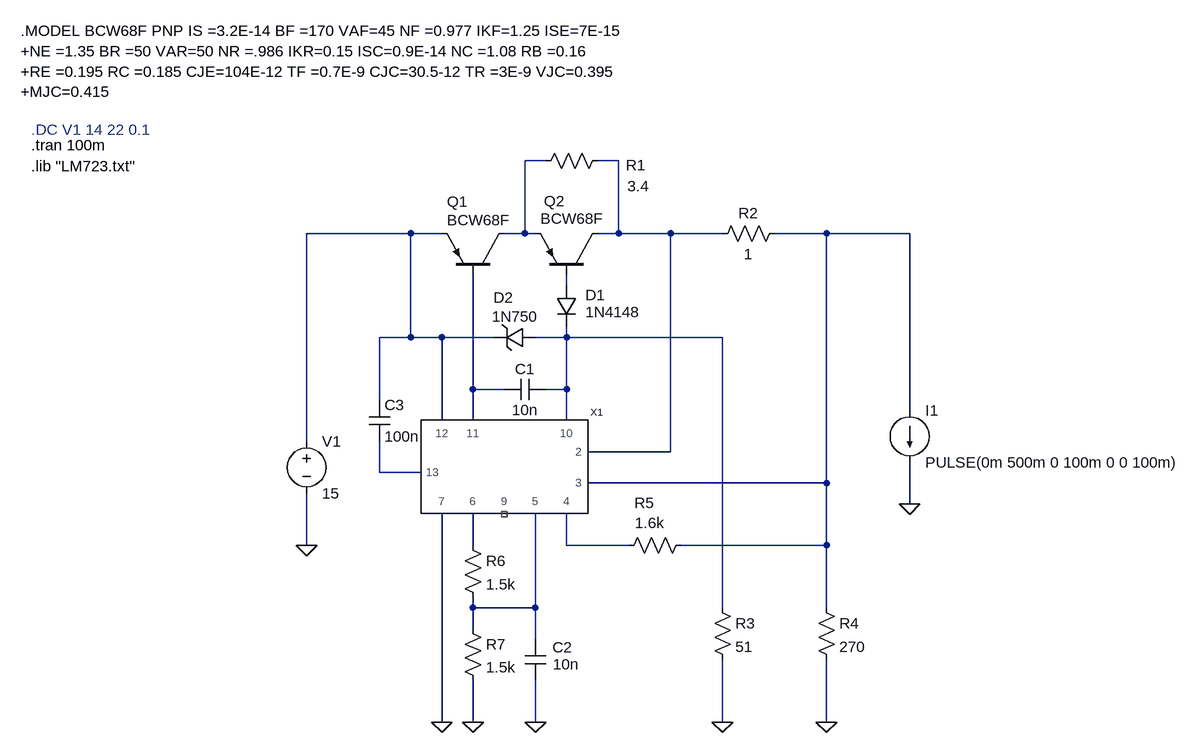
[diagram p0: schematic Lab8Lm723.asc]
Lab8Lm723.asc, the LTspice schematic file:
Version 4
SHEET 1 2652 1644
WIRE 560 -624 528 -624
WIRE 672 -624 640 -624
WIRE 352 -512 192 -512
WIRE 400 -512 352 -512
WIRE 528 -512 528 -624
WIRE 528 -512 496 -512
WIRE 544 -512 528 -512
WIRE 672 -512 672 -624
WIRE 672 -512 640 -512
WIRE 752 -512 672 -512
WIRE 832 -512 752 -512
WIRE 992 -512 912 -512
WIRE 1120 -512 992 -512
WIRE 592 -432 592 -448
WIRE 352 -352 352 -512
WIRE 352 -352 304 -352
WIRE 400 -352 352 -352
WIRE 480 -352 400 -352
WIRE 592 -352 592 -368
WIRE 592 -352 544 -352
WIRE 832 -352 592 -352
WIRE 448 -272 448 -448
WIRE 496 -272 448 -272
WIRE 592 -272 592 -352
WIRE 592 -272 560 -272
WIRE 304 -256 304 -352
WIRE 1120 -240 1120 -512
WIRE 400 -224 400 -352
WIRE 448 -224 448 -272
WIRE 592 -224 592 -272
WIRE 192 -192 192 -512
WIRE 752 -176 752 -512
WIRE 752 -176 624 -176
WIRE 304 -144 304 -192
WIRE 368 -144 304 -144
WIRE 992 -128 992 -512
WIRE 992 -128 624 -128
WIRE 1120 -96 1120 -160
WIRE 192 -32 192 -112
WIRE 448 -32 448 -80
WIRE 592 -32 592 -80
WIRE 688 -32 592 -32
WIRE 992 -32 992 -128
WIRE 992 -32 768 -32
WIRE 448 64 448 48
WIRE 544 64 544 -80
WIRE 544 64 448 64
WIRE 832 64 832 -352
WIRE 992 64 992 -32
WIRE 448 96 448 64
WIRE 544 112 544 64
WIRE 400 240 400 -80
WIRE 448 240 448 176
WIRE 544 240 544 176
WIRE 832 240 832 144
WIRE 992 240 992 144
FLAG 192 -32 0
FLAG 1120 -96 0
FLAG 832 240 0
FLAG 992 240 0
FLAG 400 240 0
FLAG 448 240 0
FLAG 544 240 0
SYMBOL LM723 496 -144 R0
SYMATTR InstName X1
SYMATTR Prefix X
SYMATTR SpiceModel LM723
SYMBOL voltage 192 -208 R0
WINDOW 123 0 0 Left 2
WINDOW 39 0 0 Left 2
SYMATTR InstName V1
SYMATTR Value 15
SYMBOL pnp 496 -448 M270
WINDOW 0 113 88 VLeft 2
WINDOW 3 85 88 VLeft 2
SYMATTR InstName Q1
SYMATTR Value BCW68F
SYMBOL pnp 640 -448 M270
WINDOW 0 114 83 VLeft 2
WINDOW 3 87 88 VLeft 2
SYMATTR InstName Q2
SYMATTR Value BCW68F
SYMBOL diode 576 -432 R0
WINDOW 0 45 15 Left 2
WINDOW 3 45 41 Left 2
SYMATTR InstName D1
SYMATTR Value 1N4148
SYMBOL res 656 -640 R90
WINDOW 0 38 -43 VBottom 2
WINDOW 3 39 -47 VTop 2
SYMATTR InstName R1
SYMATTR Value 3.4
SYMBOL cap 560 -288 R90
WINDOW 0 0 32 VBottom 2
WINDOW 3 32 32 VTop 2
SYMATTR InstName C1
SYMATTR Value 10n
SYMBOL res 928 -528 R90
WINDOW 0 0 56 VBottom 2
WINDOW 3 32 56 VTop 2
SYMATTR InstName R2
SYMATTR Value 1
SYMBOL zener 544 -368 R90
WINDOW 0 -30 49 VBottom 2
WINDOW 3 -32 31 VTop 2
SYMATTR InstName D2
SYMATTR Value 1N750
SYMATTR Description Diode
SYMATTR Type diode
SYMBOL res 816 48 R0
SYMATTR InstName R3
SYMATTR Value 51
SYMBOL res 976 48 R0
SYMATTR InstName R4
SYMATTR Value 270
SYMBOL res 784 -48 R90
WINDOW 0 -34 72 VBottom 2
WINDOW 3 -34 64 VTop 2
SYMATTR InstName R5
SYMATTR Value 1.6k
SYMBOL res 432 -48 R0
SYMATTR InstName R6
SYMATTR Value 1.5k
SYMBOL res 432 80 R0
SYMATTR InstName R7
SYMATTR Value 1.5k
SYMBOL cap 528 112 R0
WINDOW 0 42 13 Left 2
WINDOW 3 43 39 Left 2
SYMATTR InstName C2
SYMATTR Value 10n
SYMBOL cap 288 -256 R0
SYMATTR InstName C3
SYMATTR Value 100n
SYMBOL current 1120 -240 R0
WINDOW 123 0 0 Left 0
WINDOW 39 0 0 Left 0
SYMATTR InstName I1
SYMATTR Value PULSE(0m 500m 0 100m 0 0 100m)
TEXT -232 -648 Left 2 !.tran 100m
TEXT -232 -616 Left 2 !.lib "LM723.txt"
TEXT -248 -824 Left 2 !.MODEL BCW68F PNP IS =3.2E-14 BF =170 VAF=45 NF =0.977 IKF=1.25 ISE=7E-15\n+NE =1.35 BR =50 VAR=50 NR =.986 IKR=0.15 ISC=0.9E-14 NC =1.08 RB =0.16\n+RE =0.195 RC =0.185 CJE=104E-12 TF =0.7E-9 CJC=30.5-12 TR =3E-9 VJC=0.395\n+MJC=0.415
TEXT -232 -672 Left 2 ;.DC V1 14 22 0.1

The netlist it stands for:
* Lab8Lm723.asc
XX1 N002 N004 N010 N011 N009 0 NC_01 N006 N007 N003 N008 LM723  ; pins 2 3 4 5 6 7 9 10 11 12 13
V1 N003 0 15
Q1 N001 N007 N003 0 BCW68F
Q2 N002 N005 N001 0 BCW68F
D1 N005 N006 1N4148
R1 N002 N001 3.4
C1 N006 N007 10n
R2 N004 N002 1
D2 N006 N003 1N750
R3 N006 0 51
R4 N004 0 270
R5 N004 N010 1.6k
R6 N009 N011 1.5k
R7 N011 0 1.5k
C2 N011 0 10n
C3 N003 N008 100n
I1 N004 0 PULSE(0m 500m 0 100m 0 0 100m)
.model D D
.lib standard.dio
.model NPN NPN
.model PNP PNP
.lib standard.bjt
.tran 100m
.lib "LM723.txt"
.MODEL BCW68F PNP IS =3.2E-14 BF =170 VAF=45 NF =0.977 IKF=1.25 ISE=7E-15
+NE =1.35 BR =50 VAR=50 NR =.986 IKR=0.15 ISC=0.9E-14 NC =1.08 RB =0.16
+RE =0.195 RC =0.185 CJE=104E-12 TF =0.7E-9 CJC=30.5-12 TR =3E-9 VJC=0.395
+MJC=0.415
* .DC V1 14 22 0.1
.backanno
.end